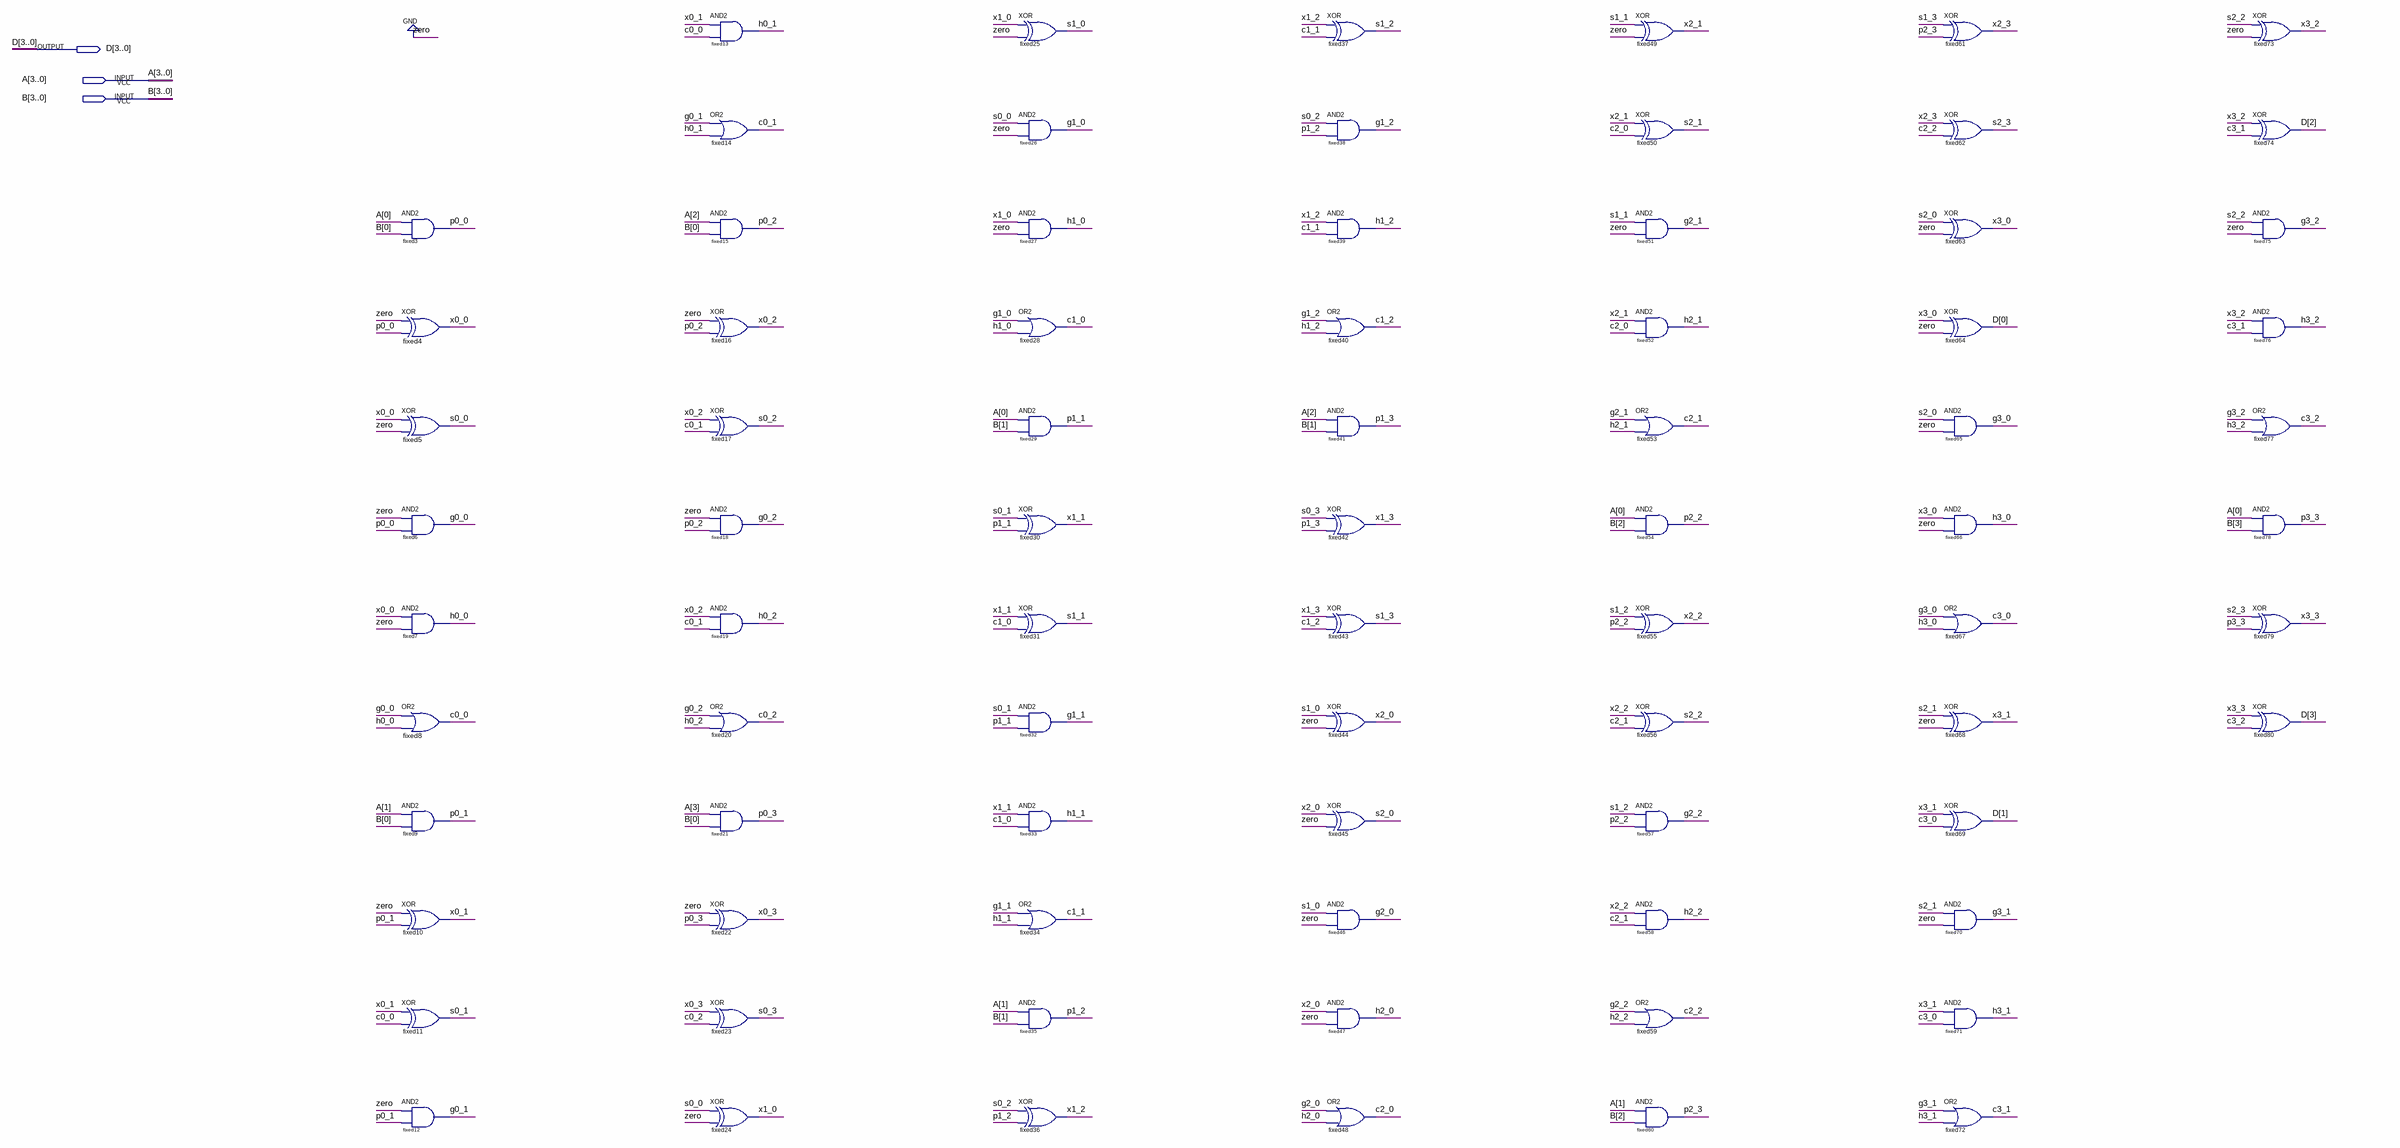
[diagram p0: schematic sheet]
// Quartus schematic mul2.bdf as structural Verilog: 78 symbols, 3 pins
module mul2 (
  input  [3:0] A,
  input  [3:0] B,
  output [3:0] D
);

  wire c0_0, c0_1, c0_2, c1_0, c1_1, c1_2, c2_0, c2_1, c2_2, c3_0, c3_1, c3_2, g0_0, g0_1, g0_2, g1_0, g1_1,
       g1_2, g2_0, g2_1, g2_2, g3_0, g3_1, g3_2, h0_0, h0_1, h0_2, h1_0, h1_1, h1_2, h2_0, h2_1, h2_2, h3_0,
       h3_1, h3_2, p0_0, p0_1, p0_2, p0_3, p1_1, p1_2, p1_3, p2_2, p2_3, p3_3, s0_0, s0_1, s0_2, s0_3, s1_0,
       s1_1, s1_2, s1_3, s2_0, s2_1, s2_2, s2_3, x0_0, x0_1, x0_2, x0_3, x1_0, x1_1, x1_2, x1_3, x2_0, x2_1,
       x2_2, x2_3, x3_0, x3_1, x3_2, x3_3;

  and fixed3 (p0_0, A[0], B[0]);
  xor fixed4 (x0_0, 1'b0, p0_0);
  xor fixed5 (s0_0, x0_0, 1'b0);
  and fixed6 (g0_0, 1'b0, p0_0);
  and fixed7 (h0_0, x0_0, 1'b0);
  or fixed8 (c0_0, g0_0, h0_0);
  and fixed9 (p0_1, A[1], B[0]);
  xor fixed10 (x0_1, 1'b0, p0_1);
  xor fixed11 (s0_1, x0_1, c0_0);
  and fixed12 (g0_1, 1'b0, p0_1);
  and fixed13 (h0_1, x0_1, c0_0);
  or fixed14 (c0_1, g0_1, h0_1);
  and fixed15 (p0_2, A[2], B[0]);
  xor fixed16 (x0_2, 1'b0, p0_2);
  xor fixed17 (s0_2, x0_2, c0_1);
  and fixed18 (g0_2, 1'b0, p0_2);
  and fixed19 (h0_2, x0_2, c0_1);
  or fixed20 (c0_2, g0_2, h0_2);
  and fixed21 (p0_3, A[3], B[0]);
  xor fixed22 (x0_3, 1'b0, p0_3);
  xor fixed23 (s0_3, x0_3, c0_2);
  xor fixed24 (x1_0, s0_0, 1'b0);
  xor fixed25 (s1_0, x1_0, 1'b0);
  and fixed26 (g1_0, s0_0, 1'b0);
  and fixed27 (h1_0, x1_0, 1'b0);
  or fixed28 (c1_0, g1_0, h1_0);
  and fixed29 (p1_1, A[0], B[1]);
  xor fixed30 (x1_1, s0_1, p1_1);
  xor fixed31 (s1_1, x1_1, c1_0);
  and fixed32 (g1_1, s0_1, p1_1);
  and fixed33 (h1_1, x1_1, c1_0);
  or fixed34 (c1_1, g1_1, h1_1);
  and fixed35 (p1_2, A[1], B[1]);
  xor fixed36 (x1_2, s0_2, p1_2);
  xor fixed37 (s1_2, x1_2, c1_1);
  and fixed38 (g1_2, s0_2, p1_2);
  and fixed39 (h1_2, x1_2, c1_1);
  or fixed40 (c1_2, g1_2, h1_2);
  and fixed41 (p1_3, A[2], B[1]);
  xor fixed42 (x1_3, s0_3, p1_3);
  xor fixed43 (s1_3, x1_3, c1_2);
  xor fixed44 (x2_0, s1_0, 1'b0);
  xor fixed45 (s2_0, x2_0, 1'b0);
  and fixed46 (g2_0, s1_0, 1'b0);
  and fixed47 (h2_0, x2_0, 1'b0);
  or fixed48 (c2_0, g2_0, h2_0);
  xor fixed49 (x2_1, s1_1, 1'b0);
  xor fixed50 (s2_1, x2_1, c2_0);
  and fixed51 (g2_1, s1_1, 1'b0);
  and fixed52 (h2_1, x2_1, c2_0);
  or fixed53 (c2_1, g2_1, h2_1);
  and fixed54 (p2_2, A[0], B[2]);
  xor fixed55 (x2_2, s1_2, p2_2);
  xor fixed56 (s2_2, x2_2, c2_1);
  and fixed57 (g2_2, s1_2, p2_2);
  and fixed58 (h2_2, x2_2, c2_1);
  or fixed59 (c2_2, g2_2, h2_2);
  and fixed60 (p2_3, A[1], B[2]);
  xor fixed61 (x2_3, s1_3, p2_3);
  xor fixed62 (s2_3, x2_3, c2_2);
  xor fixed63 (x3_0, s2_0, 1'b0);
  xor fixed64 (D[0], x3_0, 1'b0);
  and fixed65 (g3_0, s2_0, 1'b0);
  and fixed66 (h3_0, x3_0, 1'b0);
  or fixed67 (c3_0, g3_0, h3_0);
  xor fixed68 (x3_1, s2_1, 1'b0);
  xor fixed69 (D[1], x3_1, c3_0);
  and fixed70 (g3_1, s2_1, 1'b0);
  and fixed71 (h3_1, x3_1, c3_0);
  or fixed72 (c3_1, g3_1, h3_1);
  xor fixed73 (x3_2, s2_2, 1'b0);
  xor fixed74 (D[2], x3_2, c3_1);
  and fixed75 (g3_2, s2_2, 1'b0);
  and fixed76 (h3_2, x3_2, c3_1);
  or fixed77 (c3_2, g3_2, h3_2);
  and fixed78 (p3_3, A[0], B[3]);
  xor fixed79 (x3_3, s2_3, p3_3);
  xor fixed80 (D[3], x3_3, c3_2);
endmodule
